# Altium schematic sheet main.SchDoc
size A4; SheetNumber: 1; SheetTotal: 7
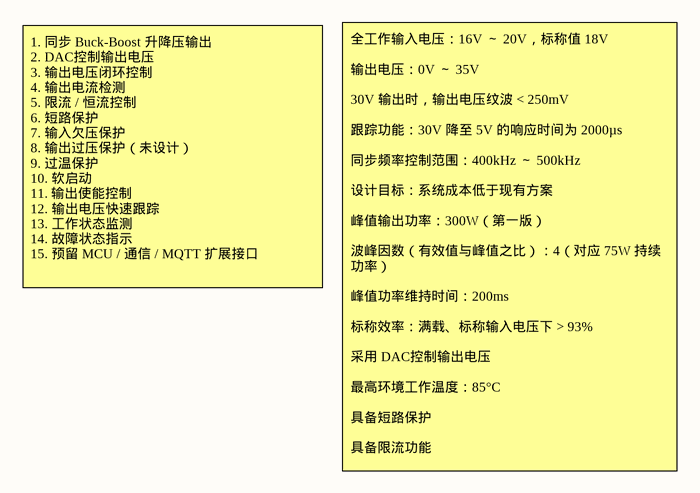
[diagram p0: main.SchDoc]

## Notes on the sheet
- 1. 同步 Buck-Boost 升降压输出
  2. DAC控制输出电压
  3. 输出电压闭环控制
  4. 输出电流检测
  5. 限流 / 恒流控制
  6. 短路保护
  7. 输入欠压保护
  8. 输出过压保护（未设计）
  9. 过温保护
  10. 软启动
  11. 输出使能控制
  12. 输出电压快速跟踪
  13. 工作状态监测
  14. 故障状态指示
  15. 预留 MCU / 通信 / MQTT 扩展接口
- 全工作输入电压：16V ～ 20V，标称值 18V
  输出电压：0V ～ 35V
  30V 输出时，输出电压纹波 < 250mV
  跟踪功能：30V 降至 5V 的响应时间为 2000µs
  同步频率控制范围：400kHz ～ 500kHz
  设计目标：系统成本低于现有方案
  峰值输出功率：300W（第一版）
  波峰因数（有效值与峰值之比）：4（对应 75W 持续功率）
  峰值功率维持时间：200ms
  标称效率：满载、标称输入电压下 > 93%
  采用 DAC控制输出电压
  最高环境工作温度：85°C
  具备短路保护
  具备限流功能